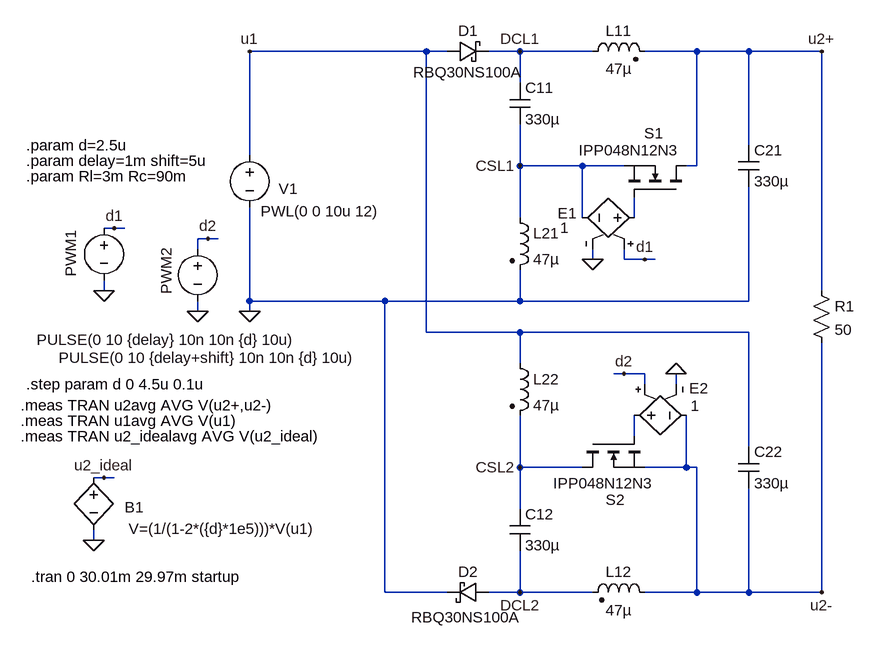
[diagram p0: schematic BC_Type3_nonideal_ccm_transferratio.asc]
BC_Type3_nonideal_ccm_transferratio.asc, the LTspice schematic file:
Version 4
SHEET 1 2984 1460
WIRE 112 224 -160 224
WIRE 144 224 112 224
WIRE 256 224 208 224
WIRE 368 224 256 224
WIRE 528 224 448 224
WIRE 608 224 528 224
WIRE 720 224 608 224
WIRE 256 272 256 224
WIRE 608 368 608 224
WIRE -160 384 -160 224
WIRE 256 400 256 336
WIRE 352 400 256 400
WIRE 416 400 352 400
WIRE 528 400 528 224
WIRE 528 400 512 400
WIRE 256 480 256 400
WIRE 352 480 352 400
WIRE 432 480 432 448
WIRE -368 496 -384 496
WIRE -352 496 -368 496
WIRE -224 512 -240 512
WIRE -208 512 -224 512
WIRE -240 528 -240 512
WIRE 368 544 368 528
WIRE 416 544 416 528
WIRE 448 544 416 544
WIRE 464 544 448 544
WIRE -384 592 -384 576
WIRE 720 592 720 224
WIRE -160 608 -160 464
WIRE 48 608 -160 608
WIRE 256 608 256 560
WIRE 256 608 48 608
WIRE 608 608 608 432
WIRE 608 608 256 608
WIRE -240 624 -240 608
WIRE -160 624 -160 608
WIRE 112 656 112 224
WIRE 256 656 112 656
WIRE 608 656 256 656
WIRE 256 704 256 656
WIRE 416 720 400 720
WIRE 448 720 416 720
WIRE 448 736 448 720
WIRE 496 736 496 720
WIRE 432 816 432 784
WIRE 608 832 608 656
WIRE 256 864 256 784
WIRE 352 864 256 864
WIRE 512 864 512 784
WIRE 512 864 448 864
WIRE 528 864 512 864
WIRE -384 880 -400 880
WIRE -368 880 -384 880
WIRE 256 928 256 864
WIRE -400 976 -400 960
WIRE 48 1056 48 608
WIRE 144 1056 48 1056
WIRE 256 1056 256 992
WIRE 256 1056 208 1056
WIRE 368 1056 256 1056
WIRE 528 1056 528 864
WIRE 528 1056 448 1056
WIRE 608 1056 608 896
WIRE 608 1056 528 1056
WIRE 720 1056 720 672
WIRE 720 1056 608 1056
FLAG -160 624 0
FLAG -384 592 0
FLAG -240 624 0
FLAG -368 496 d1
FLAG -224 512 d2
FLAG 368 544 0
FLAG 448 544 d1
FLAG 496 720 0
FLAG 416 720 d2
FLAG 720 1056 u2-
FLAG 720 224 u2+
FLAG 256 224 DCL1
FLAG 256 1056 DCL2
FLAG -400 976 0
FLAG -384 880 u2_ideal
FLAG -160 224 u1
FLAG 256 400 CSL1
FLAG 256 864 CSL2
SYMBOL cap 240 272 R0
SYMATTR InstName C11
SYMATTR Value 330µ
SYMATTR SpiceLine Rser={Rc}
SYMBOL ind2 240 464 R0
SYMATTR InstName L21
SYMATTR Value 47µ
SYMATTR Type ind
SYMATTR SpiceLine Rser={Rl}
SYMBOL ind2 352 240 R270
WINDOW 0 32 56 VTop 2
WINDOW 3 5 56 VBottom 2
SYMATTR InstName L11
SYMATTR Value 47µ
SYMATTR Type ind
SYMATTR SpiceLine Rser={Rl}
SYMBOL cap 592 368 R0
SYMATTR InstName C21
SYMATTR Value 330µ
SYMATTR SpiceLine Rser={Rc}
SYMBOL cap 240 928 R0
SYMATTR InstName C12
SYMATTR Value 330µ
SYMATTR SpiceLine Rser={Rc}
SYMBOL ind2 240 688 R0
SYMATTR InstName L22
SYMATTR Value 47µ
SYMATTR Type ind
SYMATTR SpiceLine Rser={Rl}
SYMBOL ind2 464 1072 M270
WINDOW 0 32 56 VTop 2
WINDOW 3 4 56 VBottom 2
SYMATTR InstName L12
SYMATTR Value 47µ
SYMATTR Type ind
SYMATTR SpiceLine Rser={Rl}
SYMBOL cap 592 832 R0
SYMATTR InstName C22
SYMATTR Value 330µ
SYMATTR SpiceLine Rser={Rc}
SYMBOL voltage -160 368 R0
WINDOW 123 0 0 Left 0
WINDOW 39 0 0 Left 0
WINDOW 0 45 67 Left 2
WINDOW 3 17 102 Left 2
SYMATTR InstName V1
SYMATTR Value PWL(0 0 10u 12)
SYMBOL res 704 576 R0
SYMATTR InstName R1
SYMATTR Value 50
SYMBOL voltage -384 480 R0
WINDOW 0 -35 55 VBottom 2
WINDOW 3 97 172 Top 2
WINDOW 123 0 0 Left 0
WINDOW 39 0 0 Left 0
SYMATTR InstName PWM1
SYMATTR Value PULSE(0 10 {delay} 10n 10n {d} 10u)
SYMBOL voltage -240 512 R0
WINDOW 0 -64 50 VTop 2
WINDOW 3 16 199 Bottom 2
WINDOW 123 0 0 Left 0
WINDOW 39 0 0 Left 0
SYMATTR InstName PWM2
SYMATTR Value PULSE(0 10 {delay+shift} 10n 10n {d} 10u)
SYMBOL nmos 512 448 M270
WINDOW 0 98 65 VLeft 2
WINDOW 3 72 166 VLeft 2
SYMATTR InstName S1
SYMATTR Value IPP048N12N3
SYMBOL nmos 352 816 M90
WINDOW 0 98 65 VLeft 2
WINDOW 3 72 109 VLeft 2
SYMATTR InstName S2
SYMATTR Value IPP048N12N3
SYMBOL schottky 144 240 R270
WINDOW 0 32 32 VTop 2
WINDOW 3 0 32 VBottom 2
SYMATTR InstName D1
SYMATTR Value RBQ30NS100A
SYMATTR Description Diode
SYMATTR Type diode
SYMBOL schottky 208 1040 R90
WINDOW 0 0 32 VBottom 2
WINDOW 3 39 35 VTop 2
SYMATTR InstName D2
SYMATTR Value RBQ30NS100A
SYMATTR Description Diode
SYMATTR Type diode
SYMBOL e 448 480 M270
WINDOW 0 7 134 VLeft 2
WINDOW 3 -15 130 VLeft 2
SYMATTR InstName E1
SYMATTR Value 1
SYMBOL e 416 784 M90
WINDOW 0 -42 130 VLeft 2
WINDOW 3 -15 116 VLeft 2
SYMATTR InstName E2
SYMATTR Value 1
SYMBOL bv -400 864 R0
WINDOW 0 48 61 Left 2
WINDOW 3 54 94 Left 2
SYMATTR InstName B1
SYMATTR Value V=(1/(1-2*({d}*1e5)))*V(u1)
TEXT -496 1032 Left 2 !.tran 0 30.01m 29.97m startup
TEXT -504 416 Left 2 !.param Rl=3m Rc=90m
TEXT -504 368 Left 2 !.param d=2.5u
TEXT -512 768 Left 2 !.meas TRAN u2avg AVG V(u2+,u2-)
TEXT -512 792 Left 2 !.meas TRAN u1avg AVG V(u1)
TEXT -512 816 Left 2 !.meas TRAN u2_idealavg AVG V(u2_ideal)
TEXT -504 392 Left 2 !.param delay=1m shift=5u
TEXT -504 736 Left 2 !.step param d 0 4.5u 0.1u

The netlist it stands for:
* BC_Type3_nonideal_ccm_transferratio.asc
C11 DCL1 CSL1 330µ Rser={Rc}
L21 CSL1 0 47µ Rser={Rl}
L11 DCL1 u2+ 47µ Rser={Rl}
C21 u2+ 0 330µ Rser={Rc}
C12 CSL2 DCL2 330µ Rser={Rc}
L22 u1 CSL2 47µ Rser={Rl}
L12 u2- DCL2 47µ Rser={Rl}
C22 u1 u2- 330µ Rser={Rc}
V1 u1 0 PWL(0 0 10u 12)
R1 u2+ u2- 50
V§PWM1 d1 0 PULSE(0 10 {delay} 10n 10n {d} 10u)
V§PWM2 d2 0 PULSE(0 10 {delay+shift} 10n 10n {d} 10u)
M§S1 u2+ N001 CSL1 CSL1 IPP048N12N3
M§S2 CSL2 N002 u2- u2- IPP048N12N3
D1 u1 DCL1 RBQ30NS100A
D2 DCL2 0 RBQ30NS100A
E1 N001 CSL1 d1 0 1
E2 N002 u2- d2 0 1
B1 u2_ideal 0 V=(1/(1-2*({d}*1e5)))*V(u1)
.model D D
.lib standard.dio
.model NMOS NMOS
.model PMOS PMOS
.lib standard.mos
.tran 0 30.01m 29.97m startup
.param Rl=3m Rc=90m
.param d=2.5u
.meas TRAN u2avg AVG V(u2+,u2-)
.meas TRAN u1avg AVG V(u1)
.meas TRAN u2_idealavg AVG V(u2_ideal)
.param delay=1m shift=5u
.step param d 0 4.5u 0.1u
.backanno
.end